# EAGLE design xport-v92-faxcard (EAGLE 9.6.2)
xPort Pro V.92 Fax Card: HP EIO-slot card: Lantronix xPort Pro (telnet BBS over Ethernet) bridged by an STM32 Nucleo-64 to a V.92 56k Class 1 fax modem, RJ45 and RJ11 on the faceplate
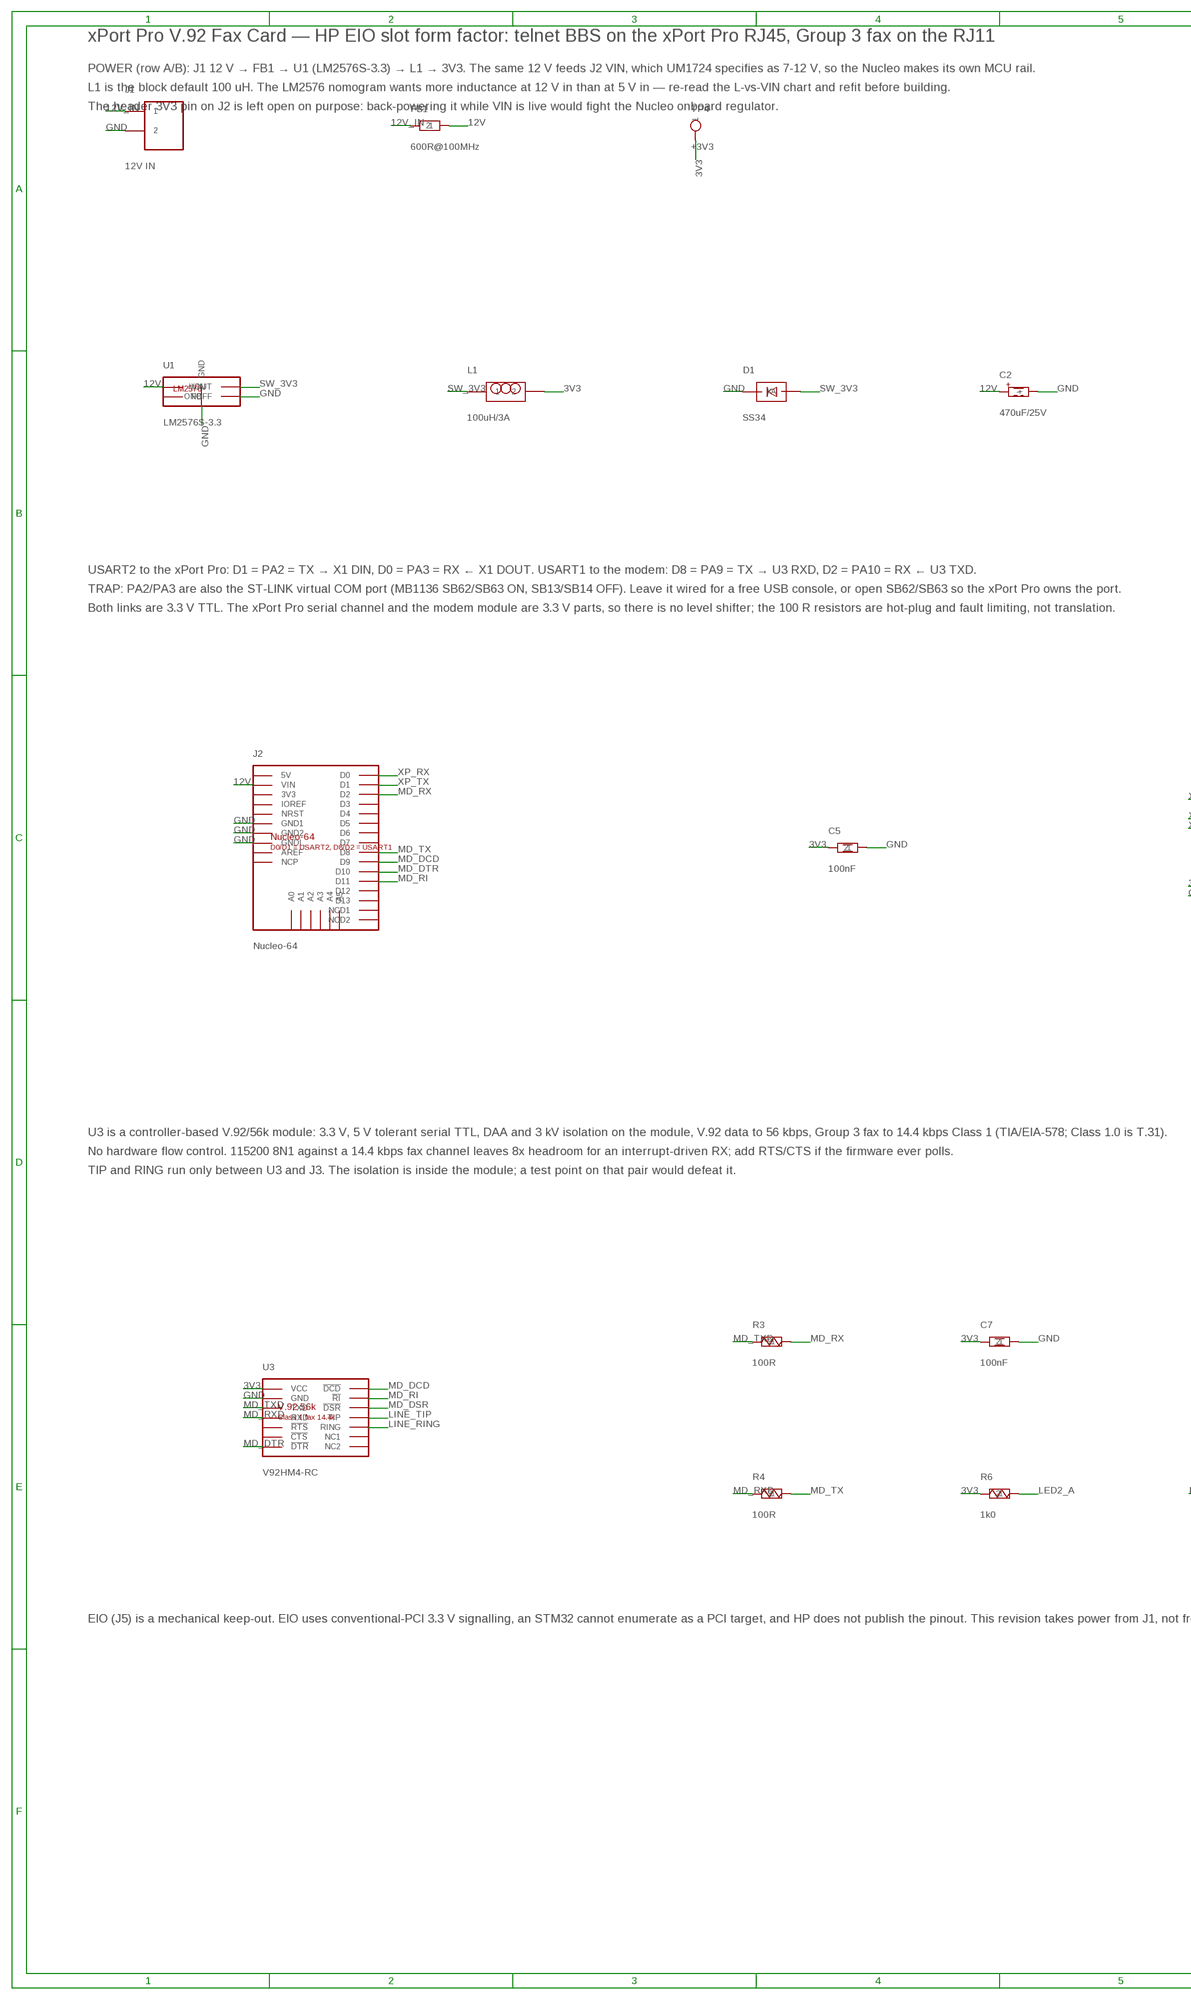
[diagram p0: schematic, sheet 1, part 1 of 2]
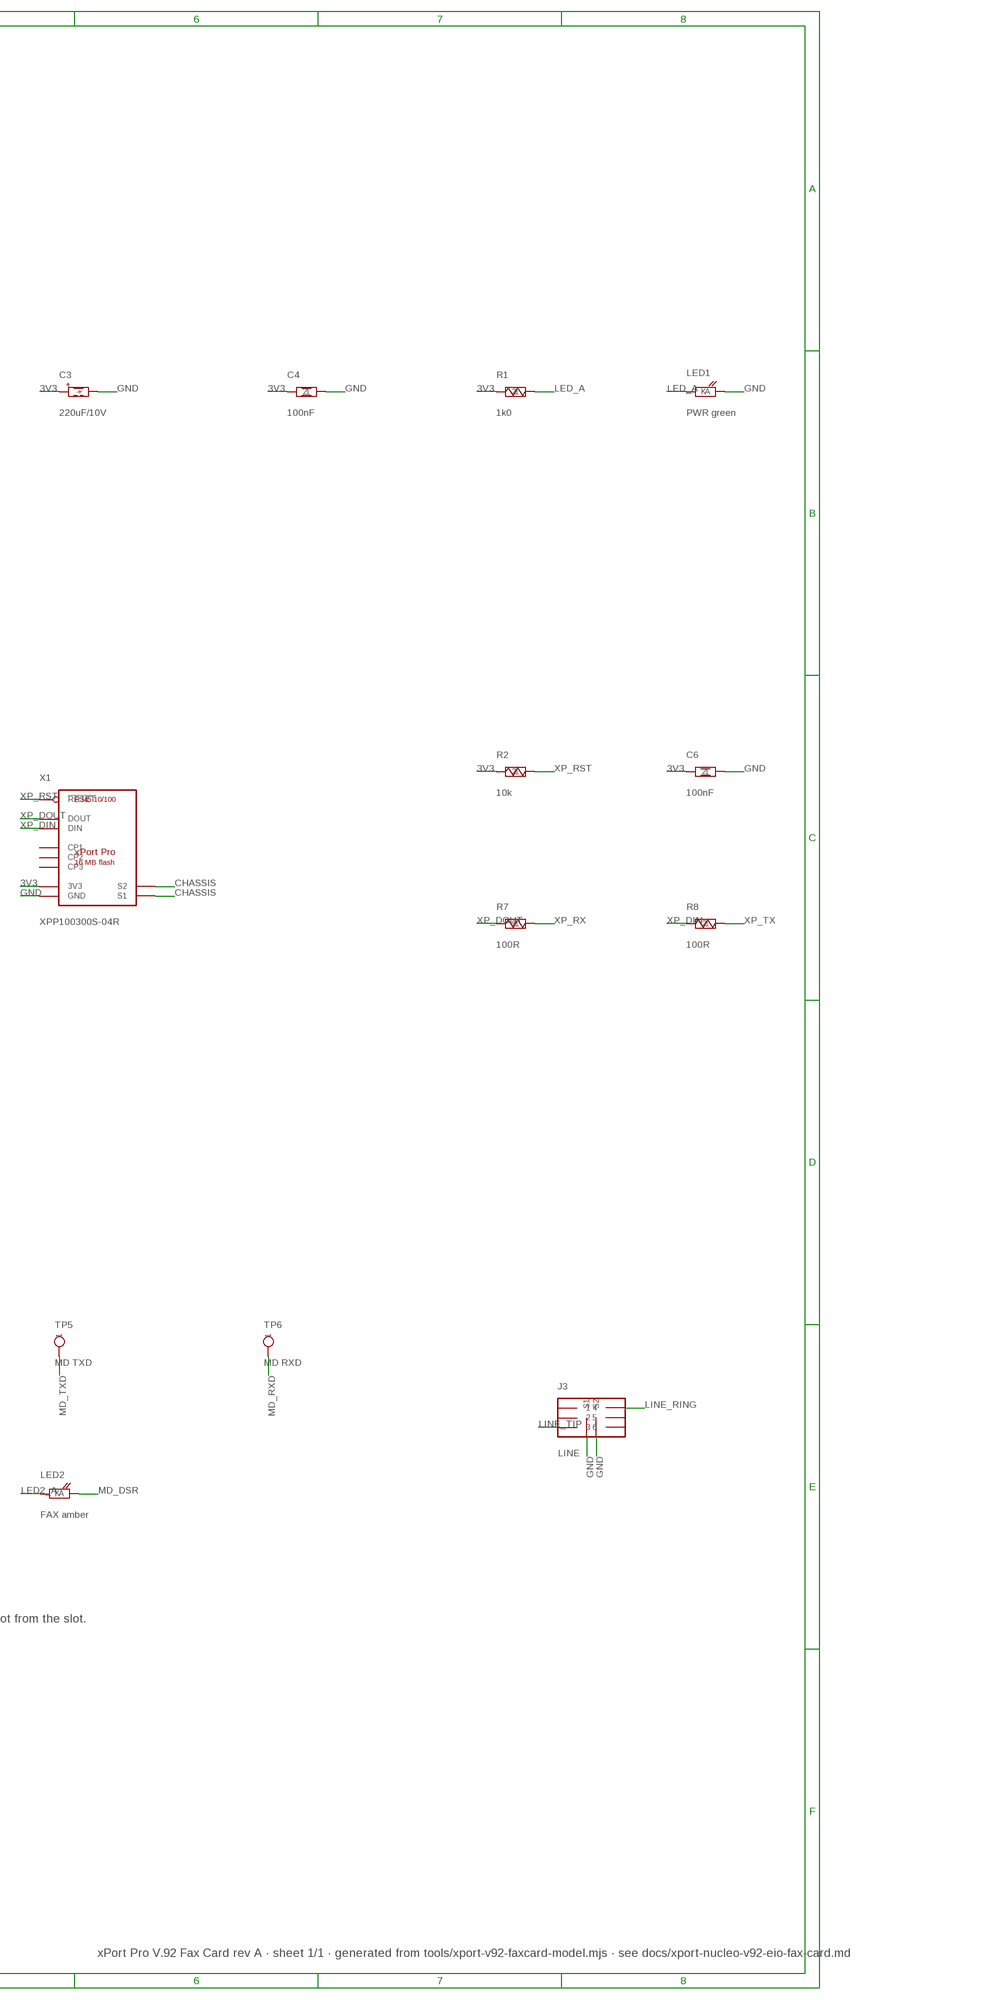
[diagram p1: schematic, sheet 1, part 2 of 2]

## Parts
C2  470uF/25V  CPOL-EU  [CP-D10-P5]
C3  220uF/10V  CPOL-EU  [CP-D10-P5]
C4  100nF  C-0603  [C0603]
C5  100nF  C-0603  [C0603]
C6  100nF  C-0603  [C0603]
C7  100nF  C-0603  [C0603]
D1  SS34  DIODE-SCH  [DO41]
FB1  600R@100MHz  FERRITE  [FB-7.62]
J1  12V IN  TERM-2  [TERM2-5.08]
J2  Nucleo-64  NUCLEO-64  [NUCLEO64]
J3  LINE  RJ11-6P4C  [RJ11-6P4C]
L1  100uH/3A  L-RADIAL  [LRAD12]
LED1  PWR green  LED  [LED-5MM]
LED2  FAX amber  LED  [LED-5MM]
R1  1k0  R-EU  [R-7.62]
R2  10k  R-EU  [R-7.62]
R3  100R  R-EU  [R-7.62]
R4  100R  R-EU  [R-7.62]
R6  1k0  R-EU  [R-7.62]
R7  100R  R-EU  [R-7.62]
R8  100R  R-EU  [R-7.62]
TP4  +3V3  TP  [TP]
TP5  MD TXD  TP  [TP]
TP6  MD RXD  TP  [TP]
U1  LM2576S-3.3  BUCK-3V3  [LM2576S]
U3  V92HM4-RC  V92-MODEM  [V92MOD]
X1  XPP100300S-04R  XPORT-PRO  [XPORTPRO]

## Nets
3V3 [power]: C3.+ C4.1 C5.1 C6.1 C7.1 L1.2 R1.1 R2.1 R6.1 TP4.1 U3.VCC X1.2(3V3)
12V [power]: C2.+ FB1.2 J2.VIN U1.1(VIN)
12V_IN [power]: FB1.1 J1.1
CHASSIS [power]: X1.S1 X1.S2
GND [power]: C2.- C3.- C4.2 C5.2 C6.2 C7.2 D1.A J1.2 J2.GND1 J2.GND2 J2.GNDL J3.S1 J3.S2 LED1.2(K) U1.3(GND) U1.3_2(GND) U1.5(ONOFF) U1.P7(GND) U1.P8(GND) U1.P9(GND) U1.P10(GND) U3.GND X1.1(GND)
LED2_A: LED2.1(A) R6.2
LED_A: LED1.1(A) R1.2
LINE_RING: J3.4 U3.RING
LINE_TIP: J3.3 U3.TIP
MD_DCD: J2.D9 U3.!DCD
MD_DSR: LED2.2(K) U3.!DSR
MD_DTR: J2.D10 U3.!DTR
MD_RI: J2.D11 U3.!RI
MD_RX: J2.D2 R3.2
MD_RXD: R4.1 TP6.1 U3.RXD
MD_TX: J2.D8 R4.2
MD_TXD: R3.1 TP5.1 U3.TXD
SW_3V3 [power]: D1.K L1.1 U1.2(VOUT)
XP_DIN: R8.1 X1.5(DIN)
XP_DOUT: R7.1 X1.4(DOUT)
XP_RST: R2.2 X1.3(!RESET)
XP_RX: J2.D0 R7.2
XP_TX: J2.D1 R8.2
Unconnected: J2.3V3 J2.5V J2.A0 J2.A1 J2.A2 J2.A3 J2.A4 J2.A5 J2.AREF J2.D3 J2.D4 J2.D5 J2.D6 J2.D7 J2.D12 J2.D13 J2.IOREF J2.NCD1 J2.NCD2 J2.NCP J2.NRST J3.1 J3.2 J3.5 J3.6 U1.4(FB) U3.!CTS U3.!RTS U3.NC1 U3.NC2 X1.6(CP1) X1.7(CP2) X1.8(CP3)

## Notes on the sheet
- xPort Pro V.92 Fax Card — HP EIO slot form factor: telnet BBS on the xPort Pro RJ45, Group 3 fax on the RJ11
- POWER (row A/B): J1 12 V → FB1 → U1 (LM2576S-3.3) → L1 → 3V3. The same 12 V feeds J2 VIN, which UM1724 specifies as 7-12 V, so the Nucleo makes its own MCU rail.
- L1 is the block default 100 uH. The LM2576 nomogram wants more inductance at 12 V in than at 5 V in — re-read the L-vs-VIN chart and refit before building.
- The header 3V3 pin on J2 is left open on purpose: back-powering it while VIN is live would fight the Nucleo onboard regulator.
- USART2 to the xPort Pro: D1 = PA2 = TX → X1 DIN, D0 = PA3 = RX ← X1 DOUT. USART1 to the modem: D8 = PA9 = TX → U3 RXD, D2 = PA10 = RX ← U3 TXD.
- TRAP: PA2/PA3 are also the ST-LINK virtual COM port (MB1136 SB62/SB63 ON, SB13/SB14 OFF). Leave it wired for a free USB console, or open SB62/SB63 so the xPort Pro owns the port.
- Both links are 3.3 V TTL. The xPort Pro serial channel and the modem module are 3.3 V parts, so there is no level shifter; the 100 R resistors are hot-plug and fault limiting, not translation.
- U3 is a controller-based V.92/56k module: 3.3 V, 5 V tolerant serial TTL, DAA and 3 kV isolation on the module, V.92 data to 56 kbps, Group 3 fax to 14.4 kbps Class 1 (TIA/EIA-578; Class 1.0 is T.31).
- No hardware flow control. 115200 8N1 against a 14.4 kbps fax channel leaves 8x headroom for an interrupt-driven RX; add RTS/CTS if the firmware ever polls.
- TIP and RING run only between U3 and J3. The isolation is inside the module; a test point on that pair would defeat it.
- EIO (J5) is a mechanical keep-out. EIO uses conventional-PCI 3.3 V signalling, an STM32 cannot enumerate as a PCI target, and HP does not publish the pinout. This revision takes power from J1, not from the slot.
- xPort Pro V.92 Fax Card rev A · sheet 1/1 · generated from tools/xport-v92-faxcard-model.mjs · see docs/xport-nucleo-v92-eio-fax-card.md

## Library data of the parts
C2 C3 = xport-v92-faxcard:CPOL-EU
C4-C7 = xport-v92-faxcard:C-0603
D1 = xport-v92-faxcard:DIODE-SCH
FB1 = xport-v92-faxcard:FERRITE
J1 = xport-v92-faxcard:TERM-2
J2 = xport-v92-faxcard:NUCLEO-64
J3 = xport-v92-faxcard:RJ11-6P4C
L1 = xport-v92-faxcard:L-RADIAL
LED1 LED2 = xport-v92-faxcard:LED
R1-R4 R6-R8 = xport-v92-faxcard:R-EU
TP4-TP6 = xport-v92-faxcard:TP
U1 = xport-v92-faxcard:BUCK-3V3
U3 = xport-v92-faxcard:V92-MODEM
X1 = xport-v92-faxcard:XPORT-PRO

## Net classes
0 default: width 0.305 mm
1 mains: width 2.5 mm, clearance 1 mm to class 0, clearance 1 mm, clearance 1 mm to class 2
2 power: width 1 mm, clearance 0.5 mm to class 0, clearance 0.6 mm

## Board
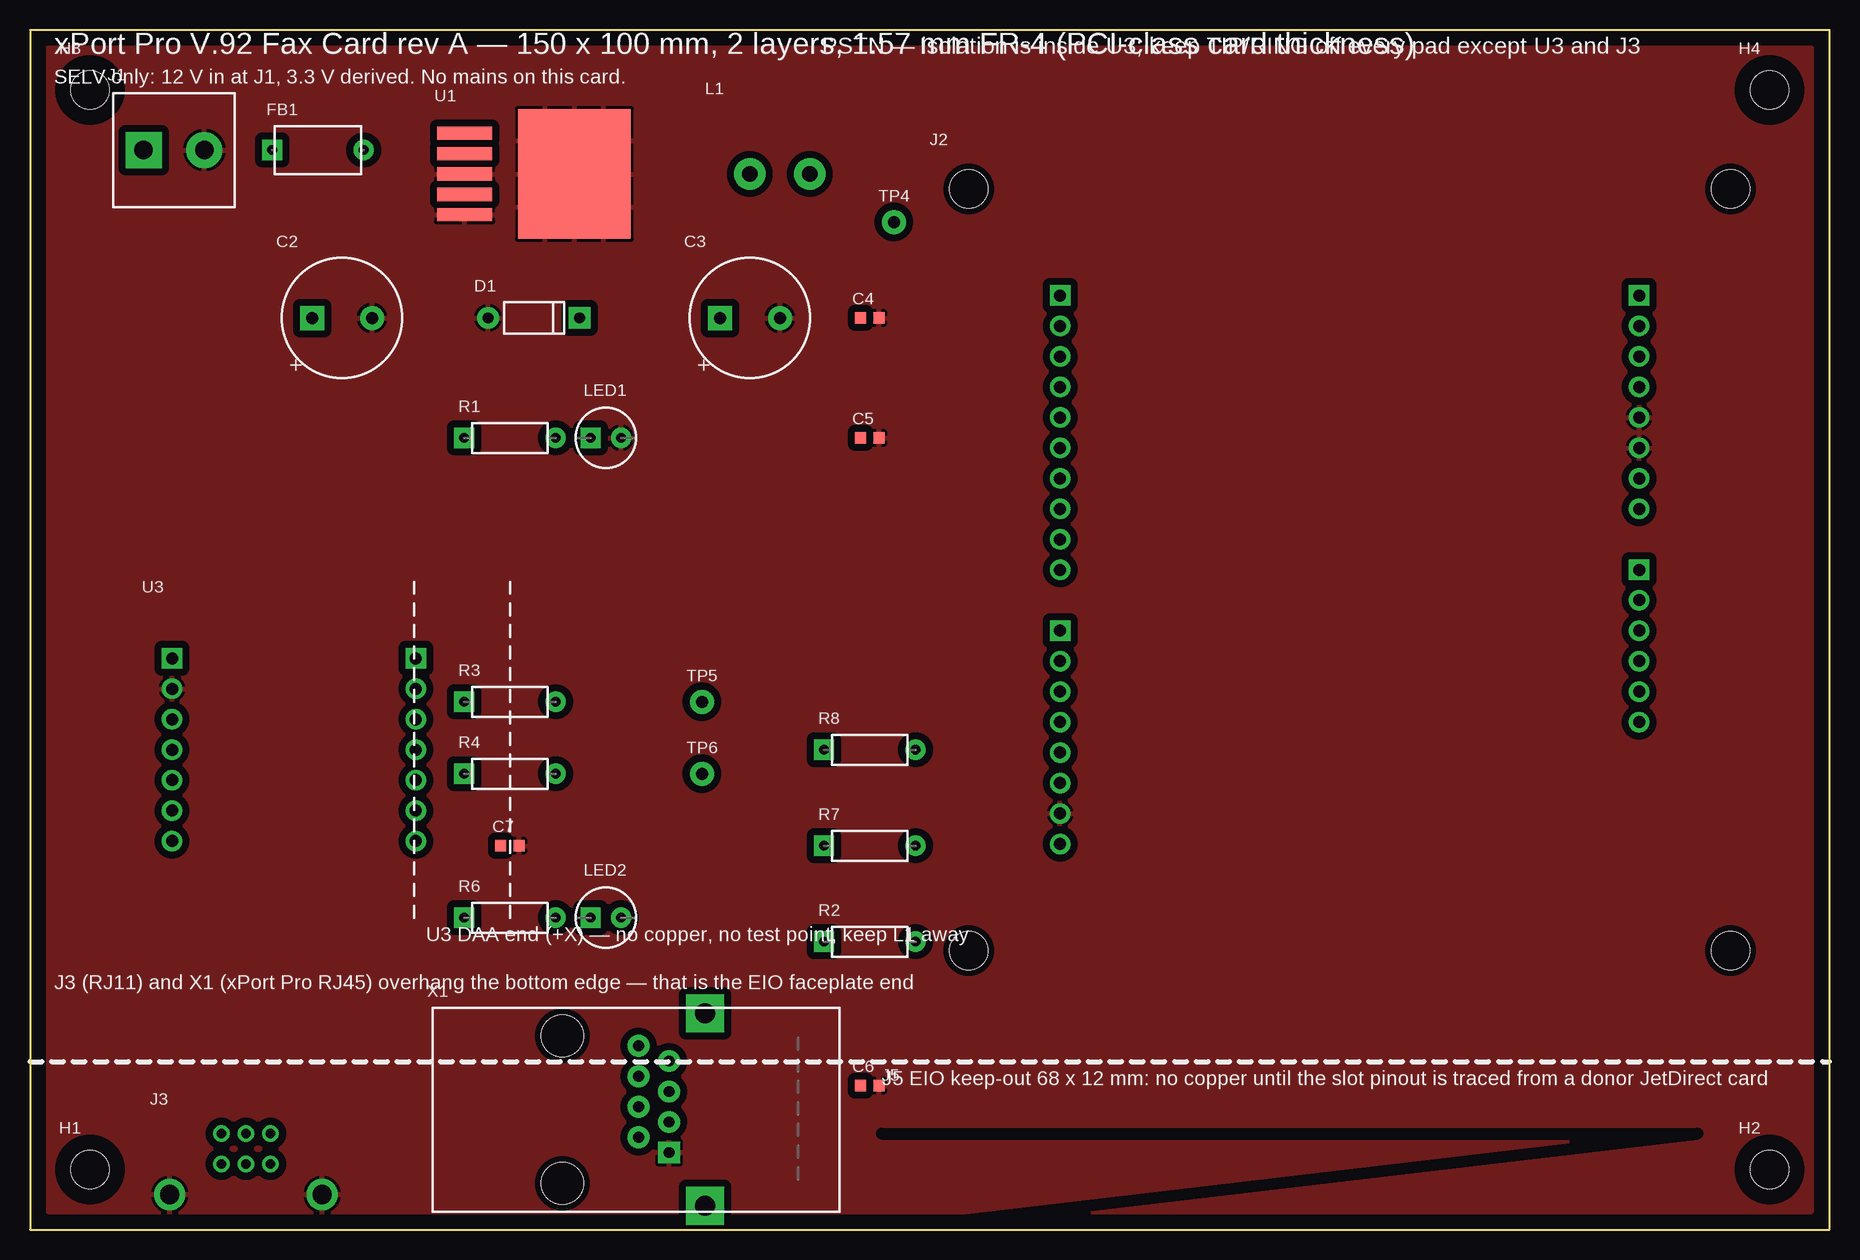
[diagram p2: board, top side]
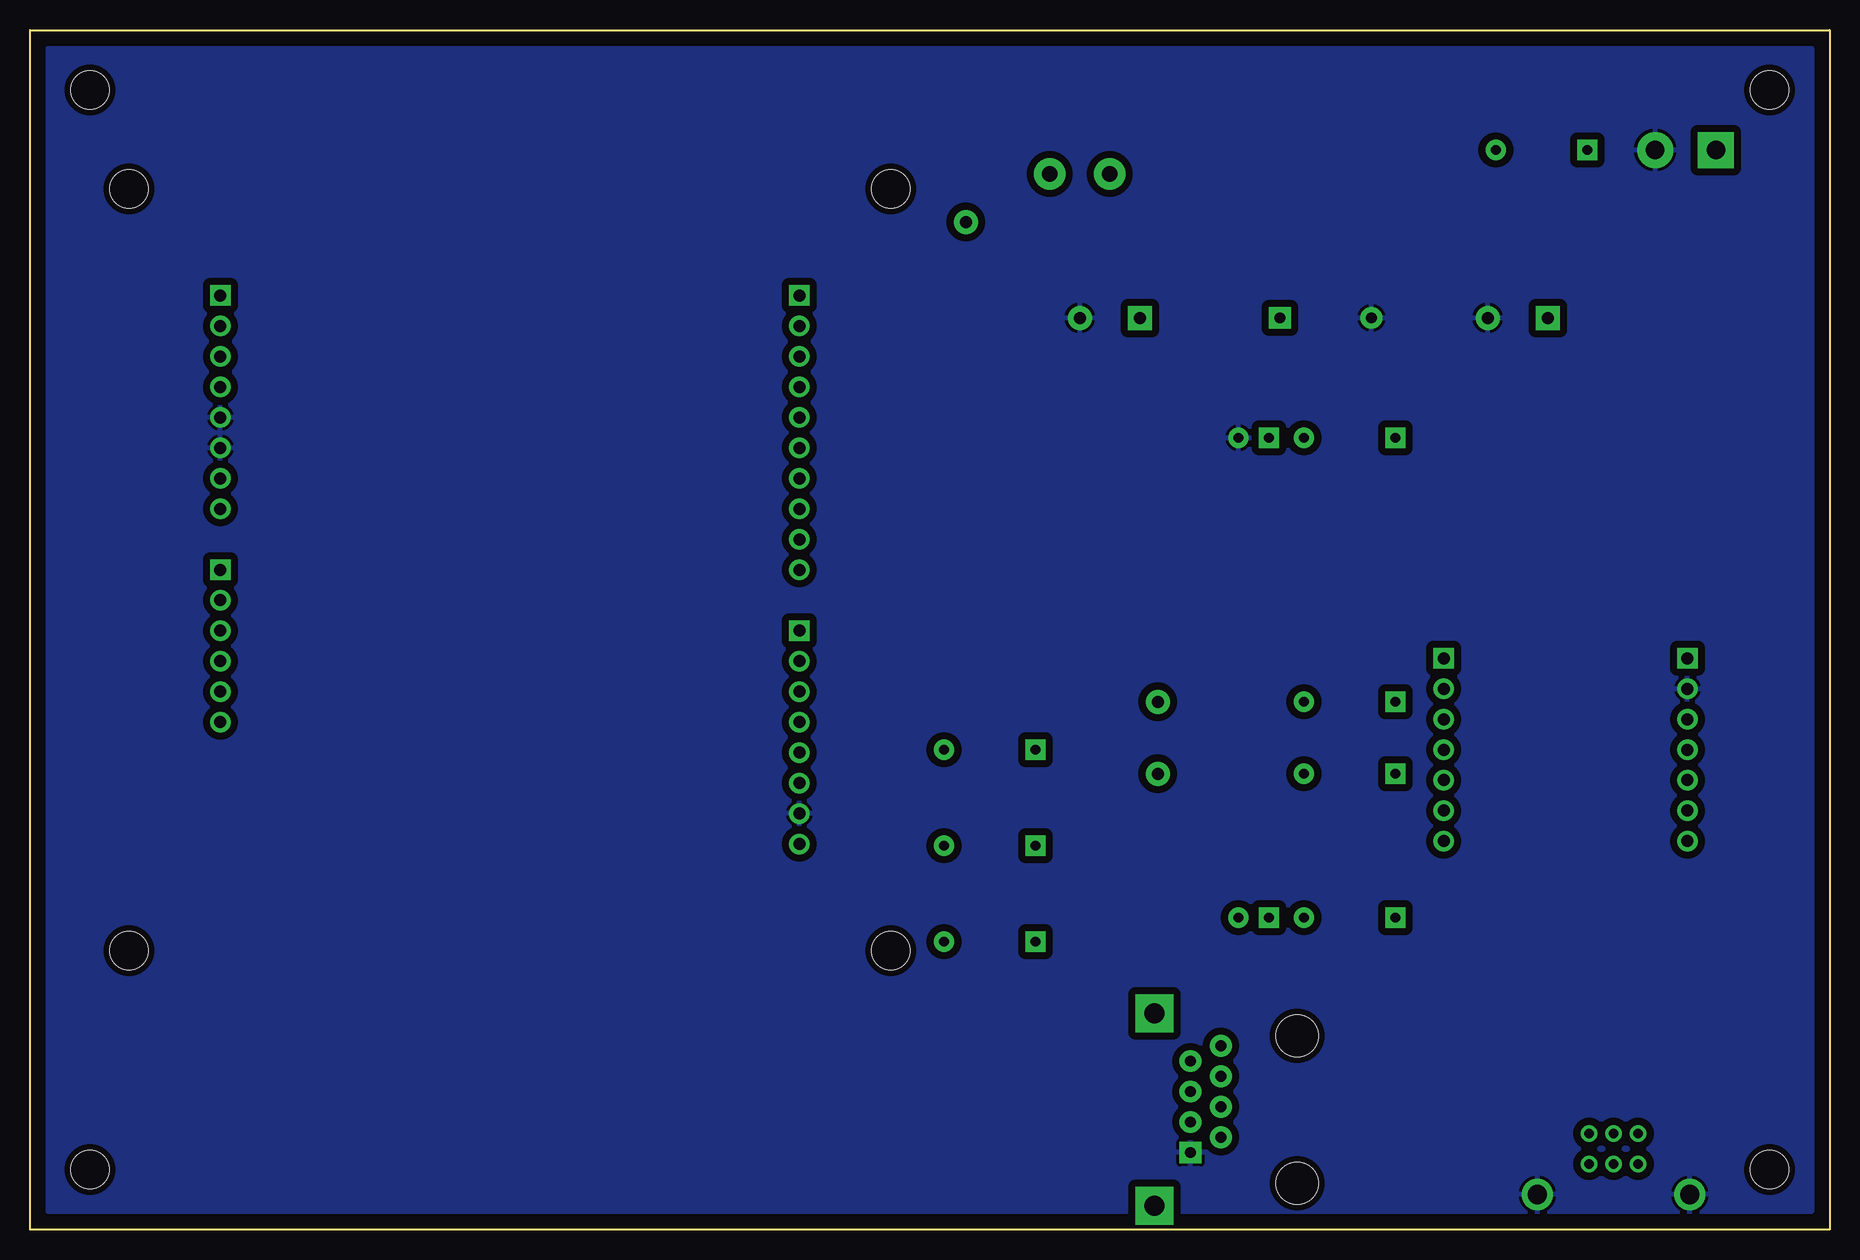
[diagram p3: board, bottom side, seen from below]

Size 150 x 100 mm. Coordinates in mm from the lower left corner, seen from the top.
Outline: 0,0 150,0 150,100 0,100 0,0
Copper layers (1*16): Top 0.035mm / dielectric 1.5mm / Bottom 0.035mm
Design rules "xport-v92-faxcard-2layer": minimum track width 8mil, minimum drill 0.35mm, track to track 8mil, track to pad 8mil, pad to pad 8mil, via to via 8mil, smd to smd 0mil, copper to edge 20mil, drill to drill 8mil, minimum pad ring 10mil, minimum via ring 8mil, stop-mask expansion 4mil, vias tented up to drill 25mil, thermal gap 10mil
tRestrict: 3 lines

### Footprints (pad centres in the part's own frame; a part is rotated, then mirrored left to right if it is on the bottom)
CP-D10-P5 = drill 1 pad 2 square: + -2.5,0 | drill 1 pad 2: - 2.5,0
C0603 = smd 0.9 x 0.95: 1 -0.775,0; 2 0.775,0
DO41 = drill 0.9 pad 1.8: A -3.81,0 | drill 0.9 pad 1.8 square: K 3.81,0
FB-7.62 = drill 0.8 pad 1.7 square: 1 -3.81,0 | drill 0.8 pad 1.7: 2 3.81,0
MOUNT-M3 = hole 3.2: 0,0
TERM2-5.08 = drill 1.52 pad 3 square: 1 -2.54,0 | drill 1.52 pad 3: 2 2.54,0
NUCLEO64 = drill 1 pad 1.7: 3V3 24.13,17.78; 5V 24.13,15.24; A1 24.13,-2.54; A2 24.13,-5.08; A3 24.13,-7.62; A4 24.13,-10.16; A5 24.13,-12.7; AREF -24.13,-22.86; D0 -24.13,5.08; D1 -24.13,7.62; D2 -24.13,10.16; D3 -24.13,12.7; D4 -24.13,15.24; D5 -24.13,17.78; D6 -24.13,20.32; D9 -24.13,-7.62; D10 -24.13,-10.16; D11 -24.13,-12.7; D12 -24.13,-15.24; D13 -24.13,-17.78; GND1 24.13,12.7; GND2 24.13,10.16; GNDL -24.13,-20.32; NCD1 -24.13,2.54; NCD2 -24.13,0; NCP 24.13,5.08; NRST 24.13,20.32; VIN 24.13,7.62 | drill 1 pad 1.7 square: A0 24.13,0; D7 -24.13,22.86; D8 -24.13,-5.08; IOREF 24.13,22.86 | hole 3.2: -31.75,31.75; 31.75,31.75; -31.75,-31.75; 31.75,-31.75
RJ11-6P4C = drill 0.8 pad 1.4: 1 -2.04,0; 2 -2.04,-2.54; 3 0,0; 4 0,-2.54; 5 2.04,0; 6 2.04,-2.54 | drill 1.6 pad 2.6: S1 -6.35,-5.08; S2 6.35,-5.08
LRAD12 = drill 1.3 pad 2.6: 1 0,0; 2 5,0
LED-5MM = drill 0.8 pad 1.7 square: 1 -1.27,0 | drill 0.8 pad 1.7: 2 1.27,0
R-7.62 = drill 0.8 pad 1.7 square: 1 -3.81,0 | drill 0.8 pad 1.7: 2 3.81,0
TP = drill 1 pad 2: 1 0,0
LM2576S = smd 4.6 x 1.1: 1 -5.775,3.4; 2 -5.775,1.7; 3 -5.775,0; 4 -5.775,-1.7; 5 -5.775,-3.4 | smd 9.4 x 10.8: 3_2 3.375,0 | smd 4.55 x 5.25: P7 5.8,-2.775; P8 0.95,2.775; P9 5.8,2.775; P10 0.95,-2.775
V92MOD = drill 1 pad 1.7: !CTS -10.16,-5.08; !DSR 10.16,2.54; !DTR -10.16,-7.62; !RI 10.16,5.08; !RTS -10.16,-2.54; GND -10.16,5.08; NC1 10.16,-5.08; NC2 10.16,-7.62; RING 10.16,-2.54; RXD -10.16,0; TIP 10.16,0; TXD -10.16,2.54 | drill 1 pad 1.7 square: !DCD 10.16,7.62; VCC -10.16,7.62
XPORTPRO = drill 0.9 pad 1.8 square: 1 1.27,-3.58 | drill 0.9 pad 1.8: 2 -1.27,-2.31; 3 1.27,-1.04; 4 -1.27,0.23; 5 1.27,1.5; 6 -1.27,2.77; 7 1.27,4.04; 8 -1.27,5.31 | drill 1.676 pad 3.175 square: S1 4.28,8.025; S2 4.28,-8.025 | hole 3.5: -7.62,6.15; -7.62,-6.15

### Placement (x,y rotation side)
C2  26,76 0 top
C3  60,76 0 top
C4  70,76 0 top
C5  70,66 0 top
C6  70,12 0 top
C7  40,32 0 top
D1  42,76 0 top
FB1  24,90 0 top
H1  [MOUNT-M3]  5,5 0 top
H2  [MOUNT-M3]  145,5 0 top
H3  [MOUNT-M3]  5,95 0 top
H4  [MOUNT-M3]  145,95 0 top
J1  12,90 0 top
J2  110,55 0 top
J3  18,8 0 top
J5  EIO  [EIO-EDGE]  105,4 0 top
L1  60,88 0 top
LED1  48,66 0 top
LED2  48,26 0 top
R1  40,66 0 top
R2  70,24 0 top
R3  40,44 0 top
R4  40,38 0 top
R6  40,26 0 top
R7  70,32 0 top
R8  70,40 0 top
TP4  72,84 0 top
TP5  56,44 0 top
TP6  56,38 0 top
U1  42,88 0 top
U3  22,40 0 top
X1  52,10 0 top

### Tracks (layer width: path | path; a pad name or v marks a point on that pad's centre or on a via)
GND
  pour Top (isolate 0.4, rank 2): 1.5,1.5 148.5,1.5 148.5,98.5 1.5,98.5
  pour Bottom (isolate 0.4, rank 2): 1.5,1.5 148.5,1.5 148.5,98.5 1.5,98.5

### Text on the board
tPlace: xPort Pro V.92 Fax Card rev A — 150 x 100 mm, 2 layers, 1.57 mm FR-4 (PCI-class card thickness) | PSTN — isolation is inside U3; keep TIP/RING off every pad except U3 and J3 | SELV only: 12 V in at J1, 3.3 V derived. No mains on this card. | U3 DAA end (+X) — no copper, no test point, keep L1 away | J3 (RJ11) and X1 (xPort Pro RJ45) overhang the bottom edge — that is the EIO faceplate end | J5 EIO keep-out 68 x 12 mm: no copper until the slot pinout is traced from a donor JetDirect card